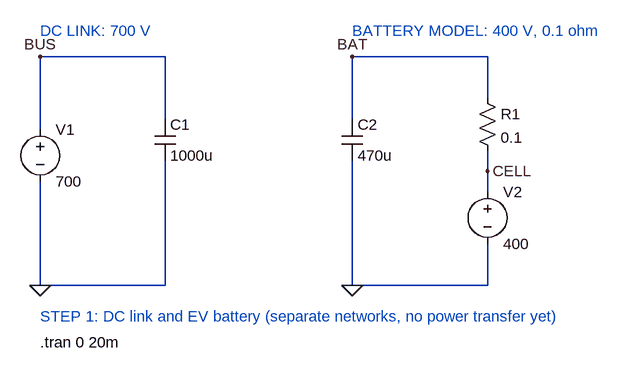
[diagram p0: schematic dc_link_baseline.asc]
dc_link_baseline.asc, the LTspice schematic file:
Version 4.1
SHEET 1 1050 650
WIRE 272 64 80 64
WIRE 80 176 80 64
WIRE 272 160 272 64
WIRE 80 416 80 256
WIRE 272 416 272 224
WIRE 272 416 80 416
WIRE 768 64 560 64
WIRE 560 160 560 64
WIRE 768 128 768 64
WIRE 768 240 768 208
WIRE 768 272 768 240
WIRE 560 416 560 224
WIRE 768 416 768 352
WIRE 768 416 560 416
FLAG 80 64 BUS
FLAG 80 416 0
FLAG 560 64 BAT
FLAG 560 416 0
FLAG 768 240 CELL
SYMBOL voltage 80 160 R0
WINDOW 123 0 0 Left 0
WINDOW 39 0 0 Left 0
SYMATTR InstName V1
SYMATTR Value 700
SYMBOL cap 256 160 R0
SYMATTR InstName C1
SYMATTR Value 1000u
SYMBOL cap 544 160 R0
SYMATTR InstName C2
SYMATTR Value 470u
SYMBOL res 752 112 R0
SYMATTR InstName R1
SYMATTR Value 0.1
SYMBOL voltage 768 256 R0
WINDOW 123 0 0 Left 0
WINDOW 39 0 0 Left 0
SYMATTR InstName V2
SYMATTR Value 400
TEXT 80 24 Left 2 ;DC LINK: 700 V
TEXT 560 24 Left 2 ;BATTERY MODEL: 400 V, 0.1 ohm
TEXT 80 464 Left 2 ;STEP 1: DC link and EV battery (separate networks, no power transfer yet)
TEXT 80 504 Left 2 !.tran 0 20m

The netlist it stands for:
* dc_link_baseline.asc
V1 BUS 0 700
C1 BUS 0 1000u
C2 BAT 0 470u
R1 BAT CELL 0.1
V2 CELL 0 400
* DC LINK: 700 V
* BATTERY MODEL: 400 V, 0.1 ohm
* STEP 1: DC link and EV battery (separate networks, no power transfer yet)
.tran 0 20m
.backanno
.end